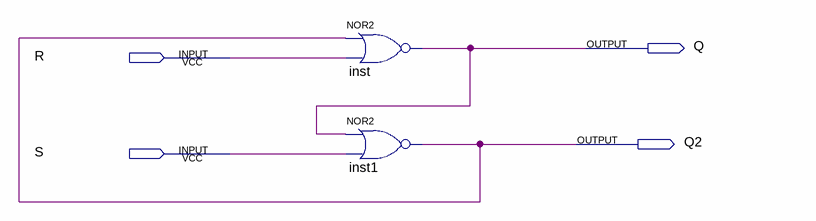
[diagram p0: schematic sheet]
// Quartus schematic practica4.bdf as structural Verilog: 2 symbols, 4 pins
module practica4 (
  input  R,
  input  S,
  output Q,
  output Q2
);

  nor inst (Q, Q2, R);
  nor inst1 (Q2, Q, S);
endmodule
